# Altium schematic sheet NC_Alimentation.SchDoc
size A4; SheetNumber: 5; SheetTotal: 5
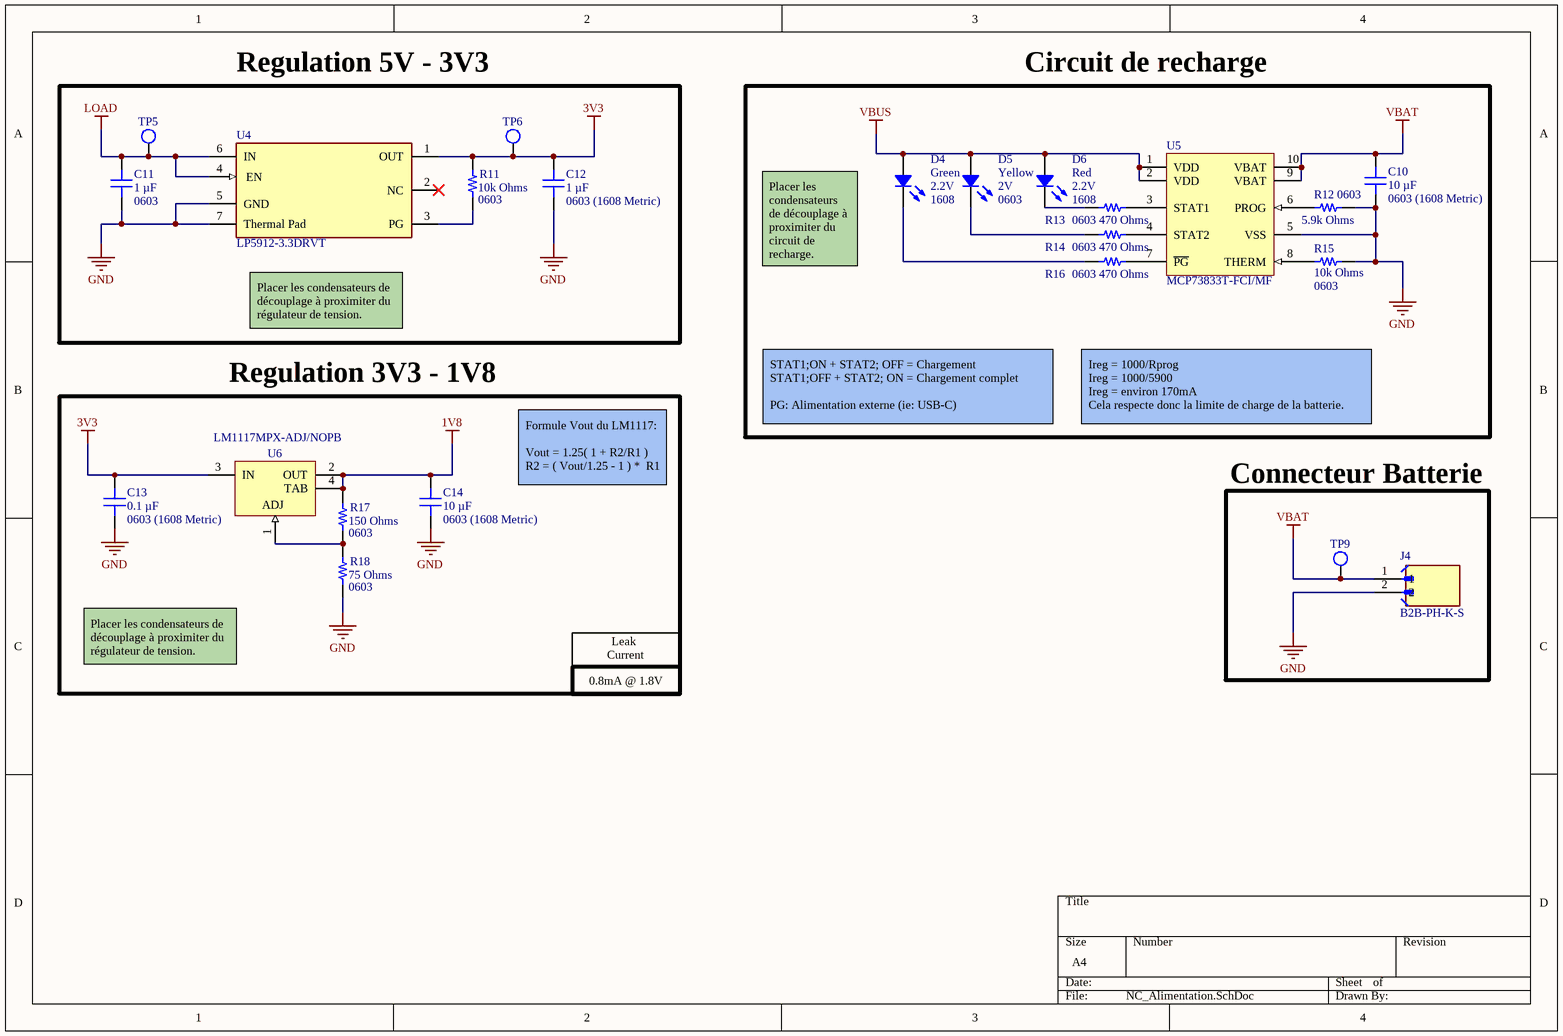
[diagram p0: NC_Alimentation.SchDoc]

## Parts
C10  Device Package: 0603 (1608 Metric)  [CAP 0603_1608]  (hidden comment: 10 µF)
C11  Device Package: 0603  [CAP 0603_1608]  (hidden comment: 1 µF)
C12  Device Package: 0603 (1608 Metric)  [CAP 0603_1608]  (hidden comment: 1 µF)
C13  Device Package: 0603 (1608 Metric)  [CAP 0603_1608]  (hidden comment: 0.1 µF)
C14  Device Package: 0603 (1608 Metric)  [CAP 0603_1608]  (hidden comment: 10 µF)
D4  Green  Supplier Device Package: 1608  Voltage - Forward (Vf) (Typ): 2.2V  [LED 0603_1608 GREEN]
D5  Yellow  Device Package: 0603  Voltage - Forward (Vf) (Typ): 2V  [LED 0603_1608 YELLOW]
D6  Red  Supplier Device Package: 1608  Voltage - Forward (Vf) (Typ): 2.2V  [LED 0603_1608 RED]
J4  B2B-PH-K-S  [JST_B2B-PH-K-S]
R11  Supplier Device Package: 0603  [RES 0603_1608]  (hidden comment: 10k Ohms)
R12  Supplier Device Package: 0603  [RES 0603_1608]  (hidden comment: 5.9k Ohms)
R13  Supplier Device Package: 0603  [RES 0603_1608]  (hidden comment: 470 Ohms)
R14  Supplier Device Package: 0603  [RES 0603_1608]  (hidden comment: 470 Ohms)
R15  Supplier Device Package: 0603  [RES 0603_1608]  (hidden comment: 10k Ohms)
R16  Supplier Device Package: 0603  [RES 0603_1608]  (hidden comment: 470 Ohms)
R17  Supplier Device Package: 0603  [RES 0603_1608]  (hidden comment: 150 Ohms)
R18  Supplier Device Package: 0603  [RES 0603_1608]  (hidden comment: 75 Ohms)
TP5  TPO_SMD_ROUND_2MM  [TPO_SMD_ROUND_2MM]  (value not drawn)  (no BOM)
TP6  TPO_SMD_ROUND_2MM  [TPO_SMD_ROUND_2MM]  (value not drawn)  (no BOM)
TP9  TPO_SMD_ROUND_2MM  [TPO_SMD_ROUND_2MM]  (value not drawn)  (no BOM)
U4  LP5912-3.3DRVT  [FP-DRV0006A-IPC_C]
U5  MCP73833T-FCI/MF  [DFN-MF10]
U6  LM1117MPX-ADJ/NOPB  [DCY0004A_N]

## Blocks framed on the sheet
Regulation 5V - 3V3: C11 C12 R11 TP5 TP6 U4
Circuit de recharge: C10 D4-D6 R12-R16 U5
Regulation 3V3 - 1V8: C13 C14 R17 R18 U6
Connecteur Batterie: J4 TP9

## Nets
1V8: C14.2 R17.1 U6.2(OUT) U6.4(TAB)
3V3: C12.2 C13.2 R11.1 TP6.1 U4.1(OUT) U6.3(IN)
GND: C10.1 C11.1 C12.1 C13.1 C14.1 J4.2 R12.2 R15.1 R18.2 U4.5(GND) U4.7(Thermal_Pad) U5.5(VSS)
LOAD: C11.2 TP5.1 U4.4(EN) U4.6(IN)
VBAT: C10.2 J4.1 TP9.1 U5.9(VBAT) U5.10(VBAT)
VBUS: D4.1 D5.1 D6.1 U5.1(VDD) U5.2(VDD)
NetD4_2: D4.2 R16.2
NetD5_2: D5.2 R14.2
NetD6_2: D6.2 R13.2
NetR11_2: R11.2 U4.3(PG)
NetR12_1: R12.1 U5.6(PROG)
NetR13_1: R13.1 U5.3(STAT1)
NetR14_1: R14.1 U5.4(STAT2)
NetR15_2: R15.2 U5.8(THERM)
NetR16_1: R16.1 U5.7(~{PG})
NetR17_2: R17.2 R18.1 U6.1(ADJ)

Not connected (* = marked no-connect by the designer): U4 2(NC)*

## Notes on the sheet
- (near D4) Placer les condensateurs de découplage à proximiter du circuit de recharge.
- (near U4) Placer les condensateurs de découplage à proximiter du régulateur de tension.
- STAT1;ON + STAT2; OFF = Chargement
  STAT1;OFF + STAT2; ON = Chargement complet
  PG: Alimentation externe (ie: USB-C)
- Ireg = 1000/Rprog
  Ireg = 1000/5900
  Ireg = environ 170mA
  Cela respecte donc la limite de charge de la batterie.
- Formule Vout du LM1117:
  Vout = 1.25( 1 + R2/R1 )
  R2 = ( Vout/1.25 - 1 ) *  R1
- Placer les condensateurs de découplage à proximiter du régulateur de tension.
- Leak
  Current
- 0.8mA @ 1.8V

## Library data of the parts
C10 C14 = GRM188R60J106ME47D: CAP CER 10UF 6.3V X5R 0603; manufacturer: Murata Electronics; Tolerance: ±20%; Part Number: GRM188R60J106ME47D; Capacitance: 10 µF; Applications: General Purpose; componentlink1description: Datasheet; componentlink1url: https://www.murata.com/~/media/webrenewal/support/library/catalog/products/capacitor/mlcc/c02e.ashx?la=en-us; componentlink2description: DigiKey Link; componentlink2url: https://www.digikey.com/en/products/detail/murata-electronics/GRM188R60J106ME47D/965910; lastupdated: 06/04/2026 19:23:52; Lifecycle Status: Active; Minimum Order: 1; Mounting Type: Surface Mount, MLCC; Operating Temperature: -55°C ~ 85°C; Package / Case: 0603 (1608 Metric); packaging: TapeAndReel; partid: 2351; Part Status: Active; price: 0.01; series: GRM; Size / Dimension: 0.063" L x 0.031" W (1.60mm x 0.80mm); Supplier 1: DigiKey; Supplier Part Number 1: 490-3896-1-ND; Temperature Coefficient: X5R; Thickness (Max): 0.035" (0.90mm); value: 10 µF; Voltage - Rated: 6.3V
C11 C12 = C0603C105K4RACAUTO: CAP CER 1UF 16V X7R 0603; manufacturer: KEMET; Tolerance: ±10%; Part Number: C0603C105K4RACAUTO; Capacitance: 1 µF; Applications: Automotive, Bypass, Decoupling; componentlink1description: Datasheet; componentlink1url: https://api.kemet.com/component-edge/download/datasheet/C0603C105K4RACAUTO.pdf; componentlink2description: DigiKey Link; componentlink2url: https://www.digikey.com/en/products/detail/kemet/C0603C105K4RACAUTO/8635831; lastupdated: 06/04/2026 19:23:53; Lifecycle Status: Active; Minimum Order: 1; Mounting Type: Surface Mount, MLCC; Operating Temperature: -55°C ~ 125°C; Package / Case: 0603 (1608 Metric); packaging: TapeAndReel; partid: 2179; Part Status: Active; price: 0.02; series: SMD Auto X7R; Size / Dimension: 0.063" L x 0.031" W (1.60mm x 0.80mm); Supplier 1: DigiKey; Supplier Part Number 1: 399-17704-1-ND; Temperature Coefficient: X7R; Thickness (Max): 0.037" (0.95mm); value: 1 µF; Voltage - Rated: 16V; Ratings: AEC-Q200
C13 = CS0603KRX7R7BB104: CAP CER 0.1UF 16V X7R 0603; manufacturer: Yageo; Tolerance: ±10%; Part Number: CS0603KRX7R7BB104; Capacitance: 0.1 µF; Applications: Boardflex Sensitive; componentlink1description: Datasheet; componentlink1url: http://www.yageo.com/NewPortal/yageodocoutput?fileName=/pdf/MLCC/UPY-ST_NPOX7R_16V-to-3KV_5.pdf; componentlink2description: DigiKey Link; componentlink2url: https://www.digikey.com/en/products/detail/yageo/CS0603KRX7R7BB104/6097897; lastupdated: 06/04/2026 19:23:52; Lifecycle Status: Active; Minimum Order: 1; Mounting Type: Surface Mount, MLCC; Operating Temperature: -55°C ~ 125°C; Package / Case: 0603 (1608 Metric); packaging: TapeAndReel; partid: 2286; Part Status: Active; price: 0.02; series: CS; Size / Dimension: 0.063" L x 0.031" W (1.60mm x 0.80mm); Supplier 1: DigiKey; Supplier Part Number 1: 311-3560-1-ND; Temperature Coefficient: X7R; Thickness (Max): 0.037" (0.95mm); value: 0.1 µF; Voltage - Rated: 16V; Features: Soft Termination
D4 = SML-D12P8WT86: LED GREEN DIFFUSED 0603 SMD; Manufacturer: Rohm Semiconductor; Configuration: Standard; Current - Test: 20mA; Lens Color: White; Lens Size: 1.20mm x 0.80mm; Lens Style: Rectangle with Flat Top; Millicandela Rating: 6.3mcd; Wavelength - Dominant: 560nm; Part Number: SML-D12P8WT86; Color: Green; ComponentLink1Description: Datasheet; ComponentLink1URL: https://www.rohm.com/datasheet/SML-D12V8W; ComponentLink2Description: DigiKey Link; ComponentLink2URL: https://www.digikey.com/en/products/detail/rohm-semiconductor/SML-D12P8WT86/1641798; Device Package: 0603 (1608 Metric); Height (Max): 0.65mm; LastUpdated: 2024-03-11 7:51:11 AM; Lens Transparency: Diffused; Lifecycle Status: Active; Minimum Order: 1; Mounting Type: Surface Mount; Package / Case: 0603 (1608 Metric); Packaging: TapeAndReel; PartId: 616; Part Status: Active; Price: 0.03; Series: EXCELED™; Size / Dimension: 1.60mm L x 0.80mm W; Supplier 1: DigiKey; Supplier Part Number 1: 511-1579-1-ND; Value: Green
D5 = SML-511WWT86: LED YELLOW DIFFUSED 0603 SMD; Manufacturer: Rohm Semiconductor; Configuration: Standard; Current - Test: 20mA; Lens Color: White; Lens Size: 1.20mm x 0.80mm; Lens Style: Rectangle with Flat Top; Millicandela Rating: 40mcd; Wavelength - Dominant: 590nm; Part Number: SML-511WWT86; Color: Yellow; ComponentLink1Description: Datasheet; ComponentLink1URL: https://media.digikey.com/pdf/Data%20Sheets/Rohm%20PDFs/SML-51_Series.pdf; ComponentLink2Description: DigiKey Link; ComponentLink2URL: https://www.digikey.com/en/products/detail/rohm-semiconductor/SML-511WWT86/637039; Height (Max): 0.65mm; LastUpdated: 2024-03-11 7:53:23 AM; Lens Transparency: Diffused; Lifecycle Status: Active; Minimum Order: 1; Mounting Type: Surface Mount; Package / Case: 0603 (1608 Metric); Packaging: TapeAndReel; PartId: 1184; Part Status: Active; Price: 0.10; Series: -; Size / Dimension: 1.60mm L x 0.80mm W; Supplier 1: DigiKey; Supplier Part Number 1: 511-1311-1-ND; Supplier Device Package: 1608 (0603); Value: Yellow
D6 = SML-D12U1WT86: LED RED DIFFUSED 1608 SMD; Manufacturer: Rohm Semiconductor; Configuration: Standard; Current - Test: 20mA; Lens Color: White; Lens Size: 1.20mm x 0.80mm; Lens Style: Rectangle with Flat Top; Millicandela Rating: 63mcd; Wavelength - Dominant: 620nm; Part Number: SML-D12U1WT86; Color: Red; ComponentLink1Description: Datasheet; ComponentLink1URL: https://www.rohm.com/datasheet/SML-D12U1W; ComponentLink2Description: DigiKey Link; ComponentLink2URL: https://www.digikey.com/en/products/detail/rohm-semiconductor/SML-D12U1WT86/5843853; Device Package: 0603 (1608 Metric); Height (Max): 0.65mm; LastUpdated: 2024-03-11 7:52:04 AM; Lens Transparency: Diffused; Lifecycle Status: Active; Minimum Order: 1; Mounting Type: Surface Mount; Package / Case: 0603 (1608 Metric); Packaging: TapeAndReel; PartId: 452; Part Status: Active; Price: 0.02; Series: SML-D12; Size / Dimension: 1.60mm L x 0.80mm W; Supplier 1: DigiKey; Supplier Part Number 1: SML-D12U1WT86CT-ND; Value: Red
J4 = CMP-005-000008-4: Connector Header Through Hole 2 position 0.079 (2.00mm); MF: JST Sales America Inc.; SnapEDA_Link: https://www.snapeda.com/parts/B2B-PH-K-S/JST/view-part/?ref=snap; Check_prices: https://www.snapeda.com/parts/B2B-PH-K-S/JST/view-part/?ref=eda; Value: *; Component Type: Standard; Source: B2B-PH-K-S.SchLib; Package: None; Design Item ID: B2B-PH-K-S; MP: B2B-PH-K-S; Pin Count: 2
R11 R12 R15 R18 = ERJ-UP3J151V: RES 150 OHM 5% 1/4W 0603; Manufacturer: Panasonic Electronic Components; Power (Watts): 0.25W, 1/4W; Resistance: 150 Ohms; Temperature Coefficient: ±200ppm/°C; Part Number: ERJ-UP3J151V; ComponentLink1Description: Datasheet; ComponentLink1URL: https://b2b-api.panasonic.eu/file_stream/pids/fileversion/4484; ComponentLink2Description: DigiKey Link; ComponentLink2URL: https://www.digikey.com/en/products/detail/panasonic-electronic-components/ERJ-UP3J151V/12092481; Composition: Thick Film; Device Package: 0603 (1608 Metric); Features: Anti-Sulfur, Automotive AEC-Q200, Pulse Withstanding; Height - Seated (Max): 0.022" (0.55mm); LastUpdated: 2024-02-09 8:41:36 PM; Lifecycle Status: Active; Minimum Order: 1; Number of Terminations: 2; Operating Temperature: -55°C ~ 155°C; Package / Case: 0603 (1608 Metric); Packaging: TapeAndReel; PartId: 63618; Part Status: Active; Price: 0.02; Ratings: AEC-Q200; Series: ERJ-UP3; Size / Dimension: 0.063" L x 0.031" W (1.60mm x 0.80mm); Supplier 1: DigiKey; Supplier Part Number 1: 10-ERJ-UP3J151VCT-ND; Tolerance: ±5%
  R11 R15: Value: 10k Ohms
  R12: Value: 5.9k Ohms
  R18: Value: 75 Ohms
R13 R14 R16 R17 = ERJ-UP3J151V: RES 150 OHM 5% 1/4W 0603; Manufacturer: Panasonic Electronic Components; Power (Watts): 0.25W, 1/4W; Temperature Coefficient: ±200ppm/°C; Part Number: ERJ-UP3J151V; ComponentLink1Description: Datasheet; ComponentLink1URL: https://b2b-api.panasonic.eu/file_stream/pids/fileversion/4484; ComponentLink2Description: DigiKey Link; ComponentLink2URL: https://www.digikey.com/en/products/detail/panasonic-electronic-components/ERJ-UP3J151V/12092481; Composition: Thick Film; Device Package: 0603 (1608 Metric); Features: Anti-Sulfur, Automotive AEC-Q200, Pulse Withstanding; Height - Seated (Max): 0.022" (0.55mm); LastUpdated: 2024-02-09 8:41:36 PM; Lifecycle Status: Active; Minimum Order: 1; Number of Terminations: 2; Operating Temperature: -55°C ~ 155°C; Package / Case: 0603 (1608 Metric); Packaging: TapeAndReel; PartId: 63618; Part Status: Active; Price: 0.02; Ratings: AEC-Q200; Series: ERJ-UP3; Size / Dimension: 0.063" L x 0.031" W (1.60mm x 0.80mm); Supplier 1: DigiKey; Supplier Part Number 1: 10-ERJ-UP3J151VCT-ND; Tolerance: ±5%
  R13 R14 R16: Value: 470 Ohms; Resistance: 470 Ohms
  R17: Value: 150 Ohms; Resistance: 150 Ohms
TP5 TP6 TP9 = CMP-007-000003-1: TPO - TEST POINT ROUND SMD PAD ONLY  - 2 MM; Component Type: Standard (No BOM); Polarized: *; Manufacturer #1: *; Part Number #1: *; HelpURL: *; Assembly Type: NONE; Source: CEGEP_SHERBROOKE_TGE_LIBRARY.SchLib; Design Item ID: TPO_SMD_ROUND_2MM; Pin Count: 1; Note: *; Value: *; Package: 2 MM ROUND; Power Max: *
U4 = CMP-04917-000099-1: IC REG LINEAR 3.3V 500MA 6SON; Dropout Voltage: 950mV; Quiescent Current: 30uA; Number of Regulators: 1; Number of Pins: 6; Max Operating Temperature: 125°C; RoHS Compliant: Yes; Packaging: Tape and Reel; Mount: Surface Mount; Output Voltage: 3.3V; Min Operating Temperature: -40°C; Lead Free: Lead Free; Output Current: 500mA
U5 = CMP-0133-00054-1: Stand-Alone Linear Li-Ion/Li-Polymer Charge Management Controller with Power-Good Output, 4.2V, 10-Pin DFN, Industrial Temperature, Tape and Reel; PackageVersion: revBB, Aug-2009; PackageDescription: 10-Lead Plastic Dual Flat, No Lead Package (MF) - 3x3x0.9mm Body [DFN]; PackageReference: DFN-MF10; DatasheetVersion: revB, May-2009
U6 = CMP-0062-01644-4: 800mA Low-Dropout Linear Regulator, 4-pin SOT-223, Pb-Free; Manufacturer: Texas Instruments; CompType: LDO IC; PowerWise: N; PackageTopMarking: XYTT*N03A; High-Reliability: Y; PackageDescription: Molded SOT-223, 6.50 x 3.56 x 1.6mm Body, 4 Lead, 2.3mm Pitch; RoHS: Y; ComponentLink1URL: http://www.ti.com/general/docs/lit/getliterature.tsp?genericPartNumber=LM1117-N&fileType=pdf; Code_JEDEC: TO-261-AA; ComponentLink1Description: Datasheet URL; PartNumber: LM1117MPX-ADJ/NOPB; PackageReference: DCY0004A; Code_IPC: SOT223-4; PinCount: 4